# Altium schematic sheet Connector_Sheet.SchDoc
size A4; SheetNumber: 6
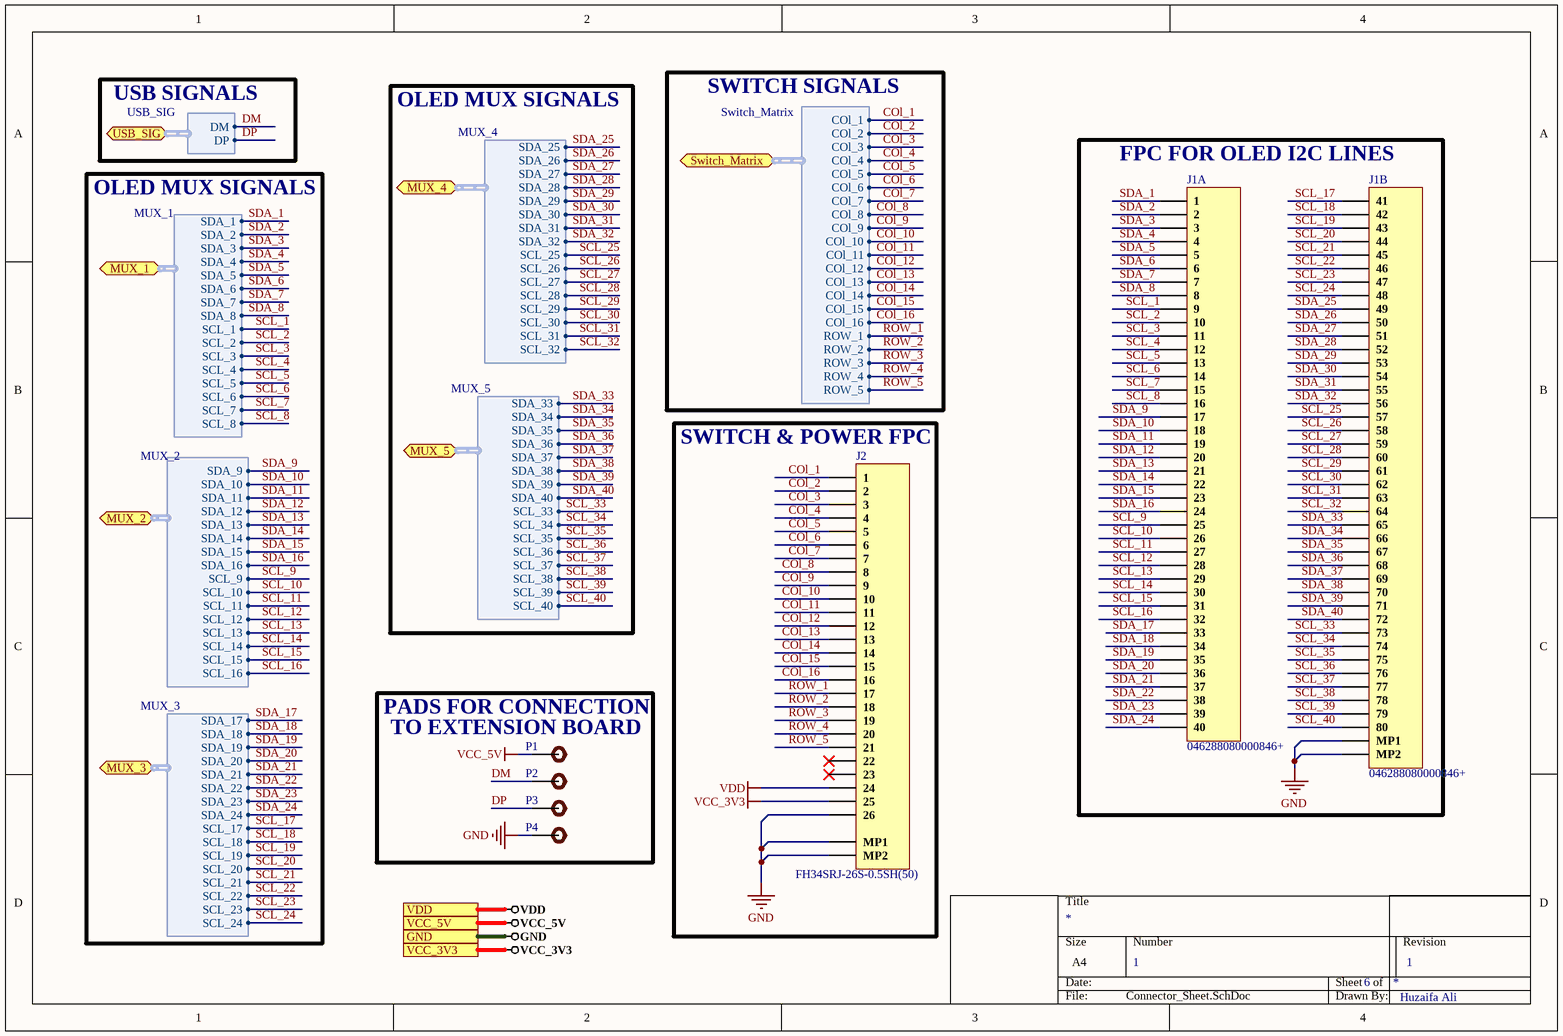
[diagram p0: Connector_Sheet.SchDoc]

## Parts
J1  046288080000846+  [046288080000846+]  (parts A,B of 2)
J2  FH34SRJ-26S-0.5SH(50)  [FH34SRJ-26S-0.5SH(50)]
P1  (no value)  [TEST POINT]
P2  (no value)  [TEST POINT]
P3  (no value)  [TEST POINT]
P4  (no value)  [TEST POINT]

## Blocks framed on the sheet
FPC FOR OLED I2C LINES: J1
SWITCH & POWER FPC: J2

## Ports
GND, MUX_1 (bidir, harness MUX_1), MUX_2 (bidir, harness MUX_2), MUX_3 (bidir, harness MUX_3), MUX_4 (bidir, harness MUX_4), MUX_5 (bidir, harness MUX_5), Switch_Matrix (bidir, harness Switch_Matrix), USB_SIG (bidir, harness USB_SIG), VCC_3V3, VCC_5V, VDD

## Harnesses
USB_SIG: DM, DP
MUX_1: SDA_1, SDA_2, SDA_3, SDA_4, SDA_5, SDA_6, SDA_7, SDA_8, SCL_1, SCL_2, SCL_3, SCL_4, SCL_5, SCL_6, SCL_7, SCL_8
MUX_2: SDA_9, SDA_10, SDA_11, SDA_12, SDA_13, SDA_14, SDA_15, SDA_16, SCL_9, SCL_10, SCL_11, SCL_12, SCL_13, SCL_14, SCL_15, SCL_16
MUX_3: SDA_17, SDA_18, SDA_19, SDA_20, SDA_21, SDA_22, SDA_23, SDA_24, SCL_17, SCL_18, SCL_19, SCL_20, SCL_21, SCL_22, SCL_23, SCL_24
MUX_4: SDA_25, SDA_26, SDA_27, SDA_28, SDA_29, SDA_30, SDA_31, SDA_32, SCL_25, SCL_26, SCL_27, SCL_28, SCL_29, SCL_30, SCL_31, SCL_32
MUX_5: SDA_33, SDA_34, SDA_35, SDA_36, SDA_37, SDA_38, SDA_39, SDA_40, SCL_33, SCL_34, SCL_35, SCL_36, SCL_37, SCL_38, SCL_39, SCL_40
Switch_Matrix: COl_1, COl_2, COl_3, COl_4, COl_5, COl_6, COl_7, ROW_1, ROW_2, ROW_3, ROW_4, ROW_5, COl_8, COl_9, COl_10, COl_11, COl_12, COl_13, COl_14, COl_15, COl_16

## Nets
GND: J1.MP1 J1.MP2 J2.26 J2.MP1 J2.MP2 P4.1 ; port GND
VCC_3V3: J2.25 ; port VCC_3V3
VCC_5V: P1.1 ; port VCC_5V
VDD: J2.24 ; port VDD
COl_1: J2.1 ; port Switch_Matrix.COl_1
COl_2: J2.2 ; port Switch_Matrix.COl_2
COl_3: J2.3 ; port Switch_Matrix.COl_3
COl_4: J2.4 ; port Switch_Matrix.COl_4
COl_5: J2.5 ; port Switch_Matrix.COl_5
COl_6: J2.6 ; port Switch_Matrix.COl_6
COl_7: J2.7 ; port Switch_Matrix.COl_7
COl_8: J2.8 ; port Switch_Matrix.COl_8
COl_9: J2.9 ; port Switch_Matrix.COl_9
COl_10: J2.10 ; port Switch_Matrix.COl_10
COl_11: J2.11 ; port Switch_Matrix.COl_11
COl_12: J2.12 ; port Switch_Matrix.COl_12
COl_13: J2.13 ; port Switch_Matrix.COl_13
COl_14: J2.14 ; port Switch_Matrix.COl_14
COl_15: J2.15 ; port Switch_Matrix.COl_15
COl_16: J2.16 ; port Switch_Matrix.COl_16
DM: P2.1 ; port USB_SIG.DM
DP: P3.1 ; port USB_SIG.DP
ROW_1: J2.17 ; port Switch_Matrix.ROW_1
ROW_2: J2.18 ; port Switch_Matrix.ROW_2
ROW_3: J2.19 ; port Switch_Matrix.ROW_3
ROW_4: J2.20 ; port Switch_Matrix.ROW_4
ROW_5: J2.21 ; port Switch_Matrix.ROW_5
SCL_1: J1.9 ; port MUX_1.SCL_1
SCL_2: J1.10 ; port MUX_1.SCL_2
SCL_3: J1.11 ; port MUX_1.SCL_3
SCL_4: J1.12 ; port MUX_1.SCL_4
SCL_5: J1.13 ; port MUX_1.SCL_5
SCL_6: J1.14 ; port MUX_1.SCL_6
SCL_7: J1.15 ; port MUX_1.SCL_7
SCL_8: J1.16 ; port MUX_1.SCL_8
SCL_9: J1.25 ; port MUX_2.SCL_9
SCL_10: J1.26 ; port MUX_2.SCL_10
SCL_11: J1.27 ; port MUX_2.SCL_11
SCL_12: J1.28 ; port MUX_2.SCL_12
SCL_13: J1.29 ; port MUX_2.SCL_13
SCL_14: J1.30 ; port MUX_2.SCL_14
SCL_15: J1.31 ; port MUX_2.SCL_15
SCL_16: J1.32 ; port MUX_2.SCL_16
SCL_17: J1.41 ; port MUX_3.SCL_17
SCL_18: J1.42 ; port MUX_3.SCL_18
SCL_19: J1.43 ; port MUX_3.SCL_19
SCL_20: J1.44 ; port MUX_3.SCL_20
SCL_21: J1.45 ; port MUX_3.SCL_21
SCL_22: J1.46 ; port MUX_3.SCL_22
SCL_23: J1.47 ; port MUX_3.SCL_23
SCL_24: J1.48 ; port MUX_3.SCL_24
SCL_25: J1.57 ; port MUX_4.SCL_25
SCL_26: J1.58 ; port MUX_4.SCL_26
SCL_27: J1.59 ; port MUX_4.SCL_27
SCL_28: J1.60 ; port MUX_4.SCL_28
SCL_29: J1.61 ; port MUX_4.SCL_29
SCL_30: J1.62 ; port MUX_4.SCL_30
SCL_31: J1.63 ; port MUX_4.SCL_31
SCL_32: J1.64 ; port MUX_4.SCL_32
SCL_33: J1.73 ; port MUX_5.SCL_33
SCL_34: J1.74 ; port MUX_5.SCL_34
SCL_35: J1.75 ; port MUX_5.SCL_35
SCL_36: J1.76 ; port MUX_5.SCL_36
SCL_37: J1.77 ; port MUX_5.SCL_37
SCL_38: J1.78 ; port MUX_5.SCL_38
SCL_39: J1.79 ; port MUX_5.SCL_39
SCL_40: J1.80 ; port MUX_5.SCL_40
SDA_1: J1.1 ; port MUX_1.SDA_1
SDA_2: J1.2 ; port MUX_1.SDA_2
SDA_3: J1.3 ; port MUX_1.SDA_3
SDA_4: J1.4 ; port MUX_1.SDA_4
SDA_5: J1.5 ; port MUX_1.SDA_5
SDA_6: J1.6 ; port MUX_1.SDA_6
SDA_7: J1.7 ; port MUX_1.SDA_7
SDA_8: J1.8 ; port MUX_1.SDA_8
SDA_9: J1.17 ; port MUX_2.SDA_9
SDA_10: J1.18 ; port MUX_2.SDA_10
SDA_11: J1.19 ; port MUX_2.SDA_11
SDA_12: J1.20 ; port MUX_2.SDA_12
SDA_13: J1.21 ; port MUX_2.SDA_13
SDA_14: J1.22 ; port MUX_2.SDA_14
SDA_15: J1.23 ; port MUX_2.SDA_15
SDA_16: J1.24 ; port MUX_2.SDA_16
SDA_17: J1.33 ; port MUX_3.SDA_17
SDA_18: J1.34 ; port MUX_3.SDA_18
SDA_19: J1.35 ; port MUX_3.SDA_19
SDA_20: J1.36 ; port MUX_3.SDA_20
SDA_21: J1.37 ; port MUX_3.SDA_21
SDA_22: J1.38 ; port MUX_3.SDA_22
SDA_23: J1.39 ; port MUX_3.SDA_23
SDA_24: J1.40 ; port MUX_3.SDA_24
SDA_25: J1.49 ; port MUX_4.SDA_25
SDA_26: J1.50 ; port MUX_4.SDA_26
SDA_27: J1.51 ; port MUX_4.SDA_27
SDA_28: J1.52 ; port MUX_4.SDA_28
SDA_29: J1.53 ; port MUX_4.SDA_29
SDA_30: J1.54 ; port MUX_4.SDA_30
SDA_31: J1.55 ; port MUX_4.SDA_31
SDA_32: J1.56 ; port MUX_4.SDA_32
SDA_33: J1.65 ; port MUX_5.SDA_33
SDA_34: J1.66 ; port MUX_5.SDA_34
SDA_35: J1.67 ; port MUX_5.SDA_35
SDA_36: J1.68 ; port MUX_5.SDA_36
SDA_37: J1.69 ; port MUX_5.SDA_37
SDA_38: J1.70 ; port MUX_5.SDA_38
SDA_39: J1.71 ; port MUX_5.SDA_39
SDA_40: J1.72 ; port MUX_5.SDA_40

Not connected (* = marked no-connect by the designer): J2 22* 23*

## Notes on the sheet
- USB SIGNALS
- OLED MUX SIGNALS
- SWITCH SIGNALS
- (near P1) PADS FOR CONNECTION
- (near P1) TO EXTENSION BOARD
- 1
- Huzaifa Ali

## Library data of the parts
J1 = 046288080000846+: 0.5MM PITCH - 80 POS - RIGHT ANG; Manufacturer: Kyocera AVX; ComponentLink1Description: LCSC; ComponentLink1URL: https://lcsc.com/product-detail/FFC-span-style-background-color-ff0-FPC-span-Connectors_Kyocera-046288080000846_C513346.html; Manufacturer Part Number: 046288080000846+; Footprint: Custom
J2 = FH34SRJ-26S-0.5SH(50): CONN FFC FPC 26POS 0.50MM R/A; Manufacturer: Hirose; Manufacturer Part Number: FH34SRJ-8S-0.5SH(99); Supplier 1: RSComponents; RoHS: Yes; Category: FFC / FPC; Stock 1: 190; Pricing 1: 5=2.79500, 25=2.28400, 100=2.17100, 250=1.96400 (USD); ComponentLink1URL: https://datasheet.ciiva.com/18561/ed-fh34s-20140305-18561974.pdf?src-supplier=Digi-Key; ComponentLink1Description: https://datasheet.ciiva.com/18561/ed-fh34s-20140305-18561974.pdf?src-supplier=Digi-Key; Supplier Part Number 1: 1362475
P1-P4 = TEST POINT: Test Point ON